# Altium schematic sheet a0206-2006.1.SchDoc
size 558 x 431 mm
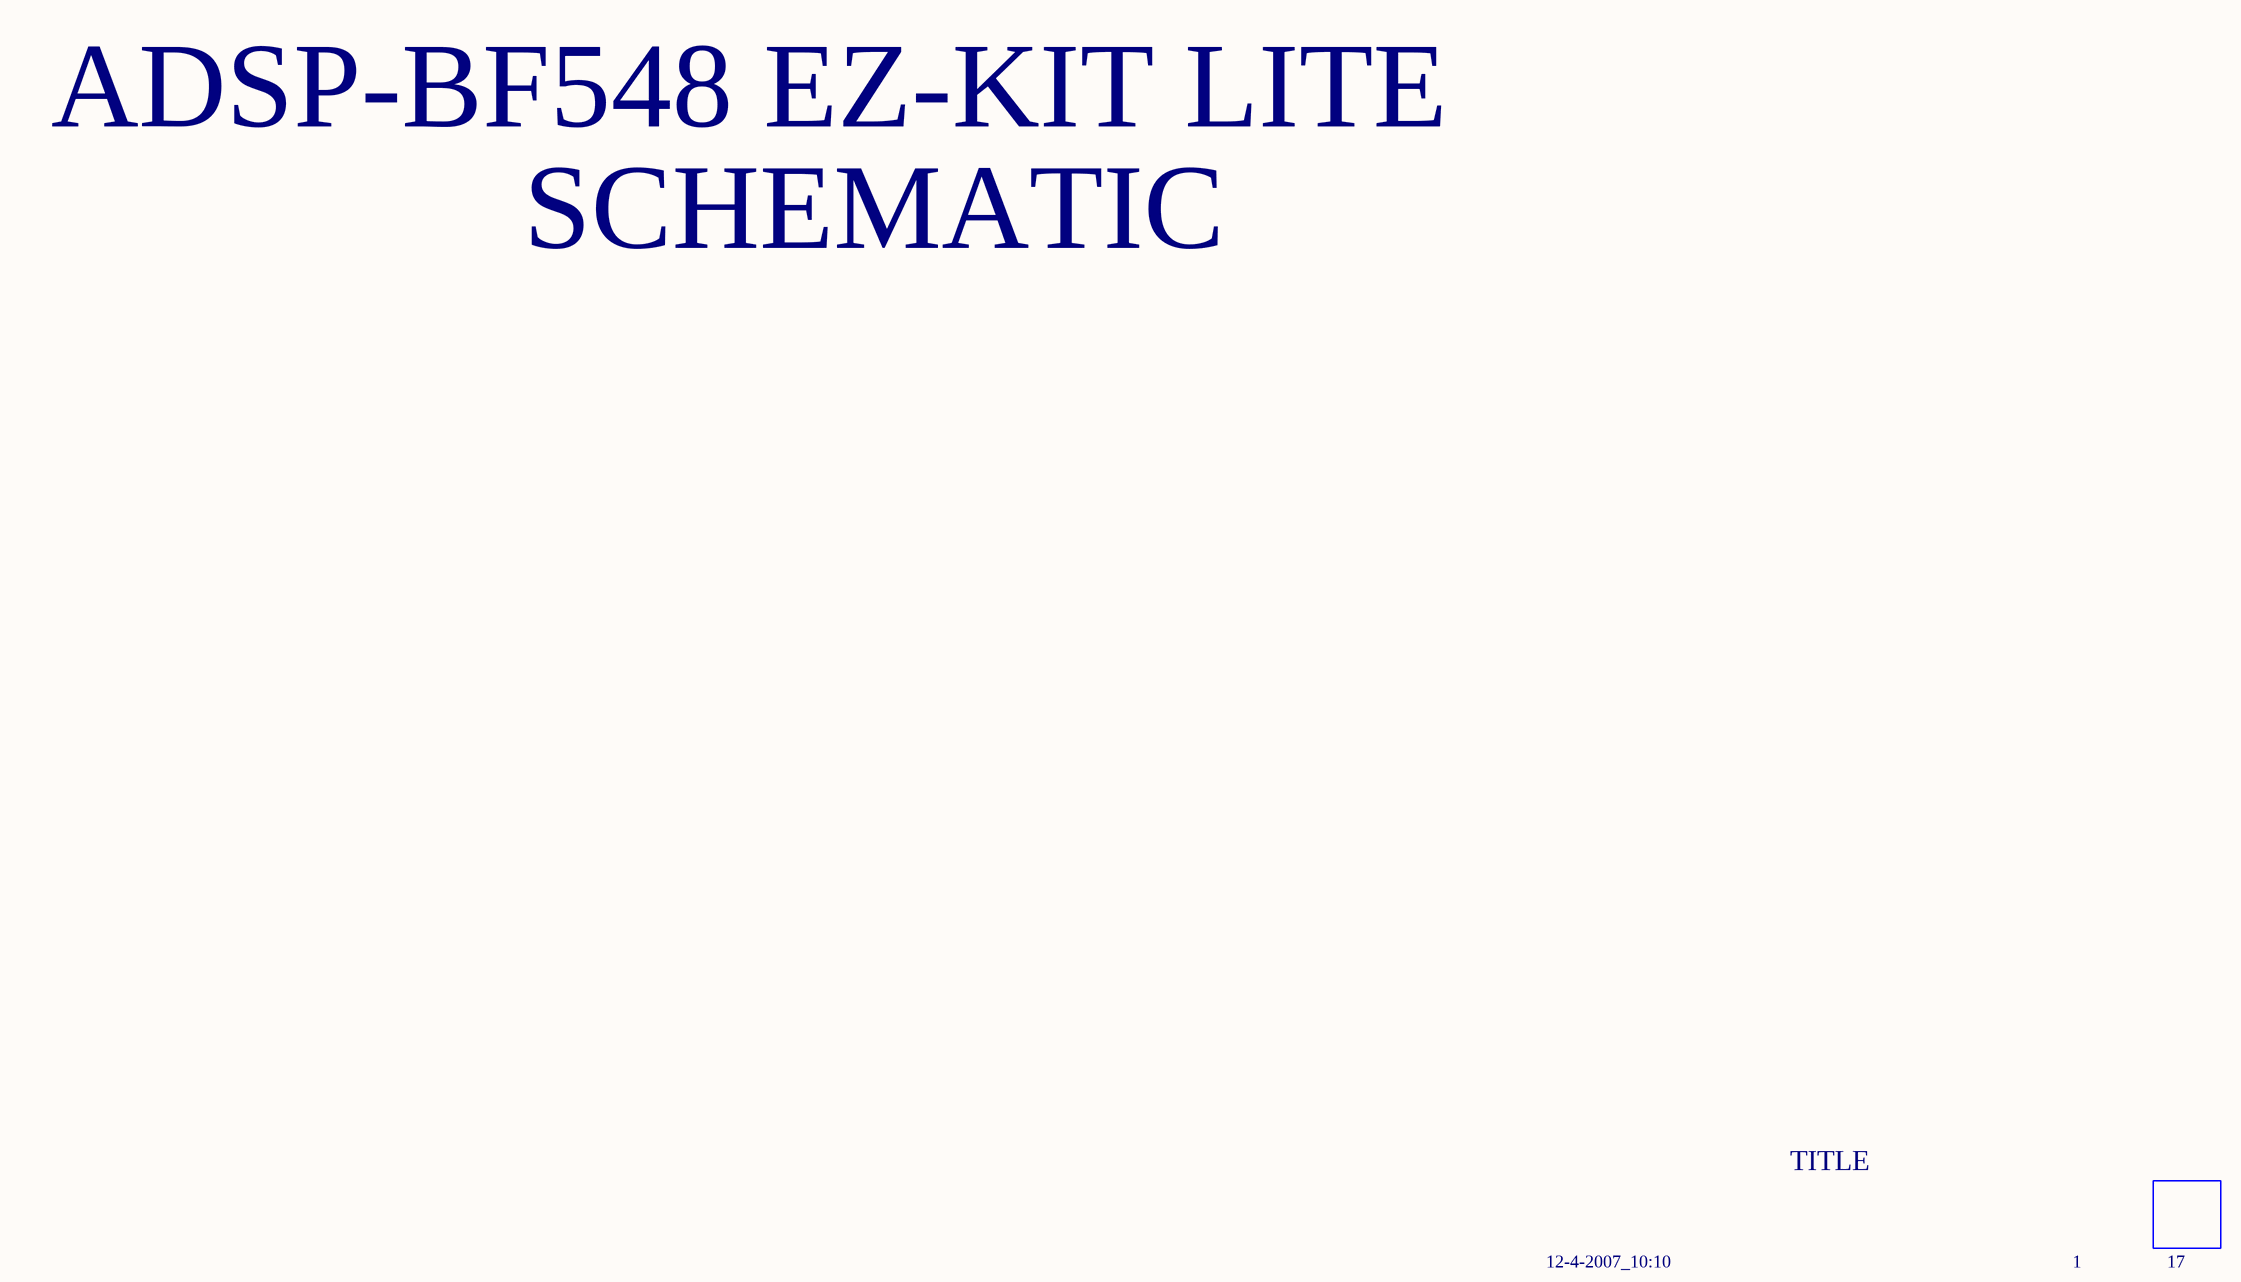
[diagram p0: a0206-2006.1.SchDoc]

## Parts
*  *  (value not drawn)

## Notes on the sheet
- ADSP-BF548 EZ-KIT LITE
- SCHEMATIC
- TITLE
- 12-4-2007_10:10
- (near *) 1
- (near *) 17
- A
- B
- C
- D
- 2
- 3
- 20 Cotton Road
- 4
- DEVICES
- ANALOG
- Nashua, NH 03063
- PH: 1-800-ANALOGD
- Title
- Size
- Board No.
- A0206-2006
- Rev
- 1.4B
- Date
- Sheet
- of

## Library data of the parts
* = BD_REV.1: CLASS: DNP; LEVEL: BD_REV